# EAGLE design bare-metal-audio_2026-09-07 (EAGLE 9.7.0)
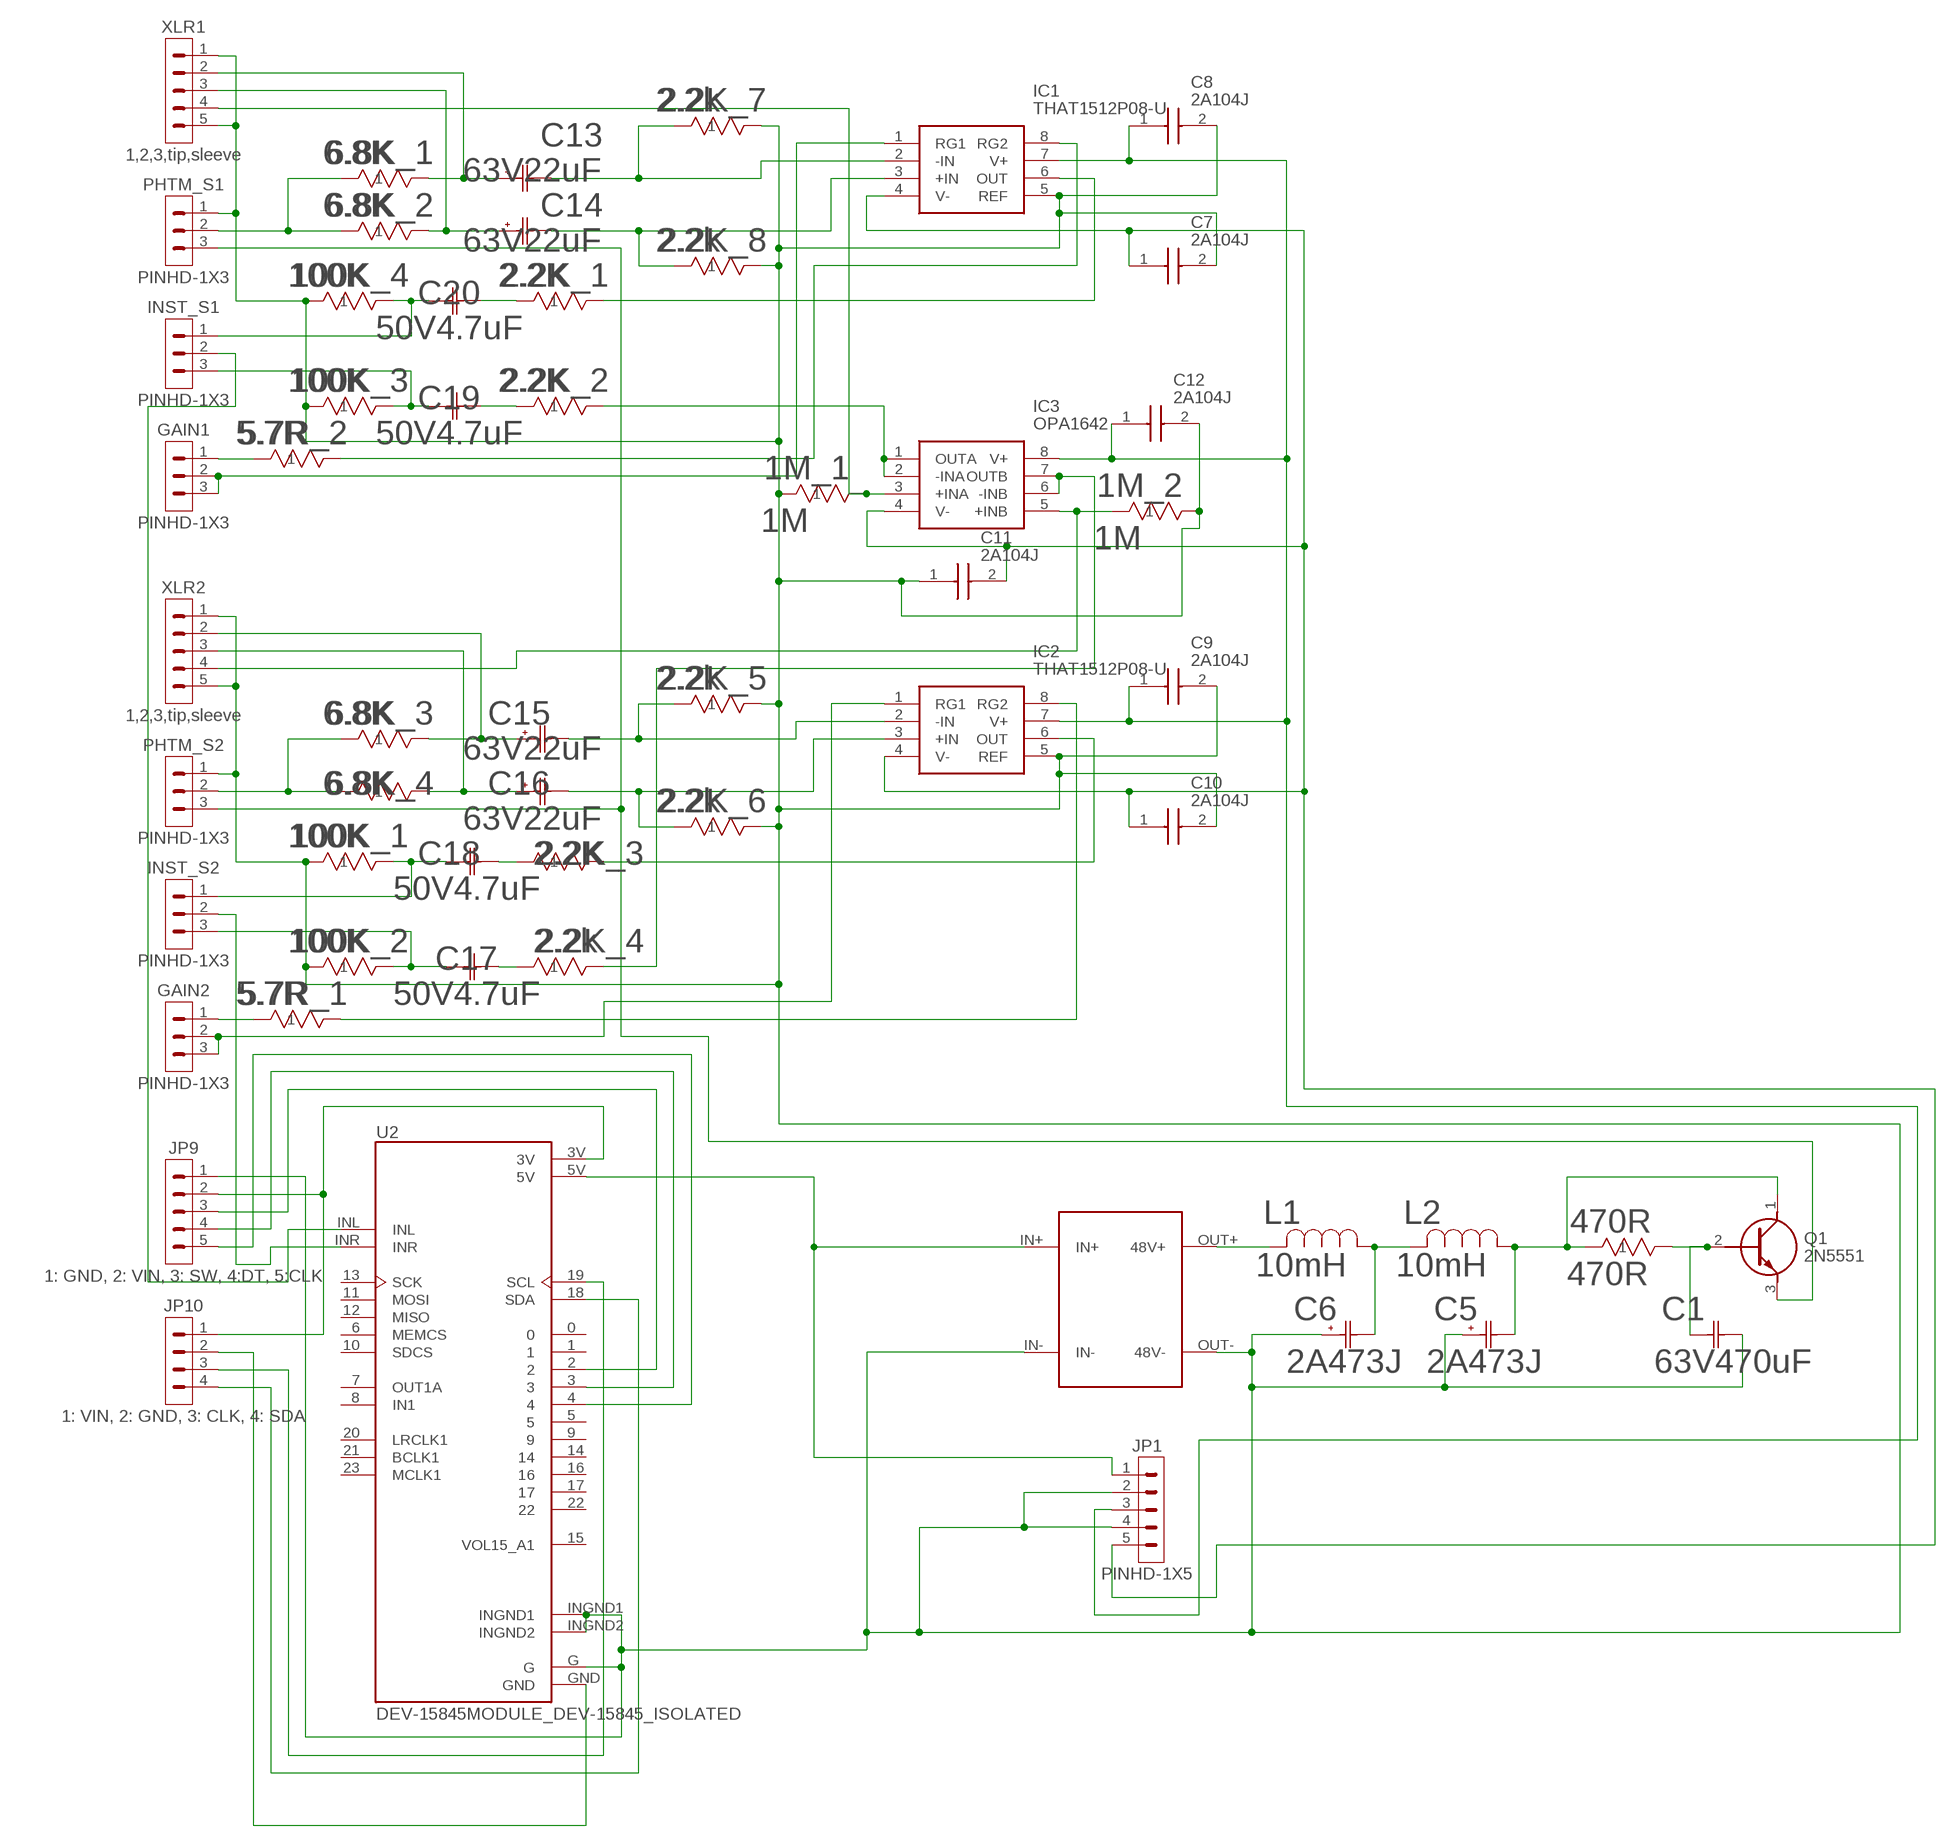
[diagram p0: schematic, sheet 1]

## Parts
1M_1  1M  YR1B100RCCRES_TYCO_YR1_TYC  [RES_TYCO_YR1_TYC]
1M_2  1M  YR1B100RCCRES_TYCO_YR1_TYC  [RES_TYCO_YR1_TYC]
2.2K_1  2.2K  YR1B100RCCRES_TYCO_YR1_TYC  [RES_TYCO_YR1_TYC]
2.2K_2  2.2K  YR1B100RCCRES_TYCO_YR1_TYC  [RES_TYCO_YR1_TYC]
2.2K_3  2.2K  YR1B100RCCRES_TYCO_YR1_TYC  [RES_TYCO_YR1_TYC]
2.2K_4  2.2k  YR1B100RCCRES_TYCO_YR1_TYC  [RES_TYCO_YR1_TYC]
2.2K_5  2.2k  YR1B100RCCRES_TYCO_YR1_TYC  [RES_TYCO_YR1_TYC]
2.2K_6  2.2k  YR1B100RCCRES_TYCO_YR1_TYC  [RES_TYCO_YR1_TYC]
2.2K_7  2.2k  YR1B100RCCRES_TYCO_YR1_TYC  [RES_TYCO_YR1_TYC]
2.2K_8  2.2k  YR1B100RCCRES_TYCO_YR1_TYC  [RES_TYCO_YR1_TYC]
5.7R_1  5.7R  YR1B100RCCRES_TYCO_YR1_TYC  [RES_TYCO_YR1_TYC]
5.7R_2  5.7R  YR1B100RCCRES_TYCO_YR1_TYC  [RES_TYCO_YR1_TYC]
6.8K_1  6.8K  YR1B100RCCRES_TYCO_YR1_TYC  [RES_TYCO_YR1_TYC]
6.8K_2  6.8K  YR1B100RCCRES_TYCO_YR1_TYC  [RES_TYCO_YR1_TYC]
6.8K_3  6.8K  YR1B100RCCRES_TYCO_YR1_TYC  [RES_TYCO_YR1_TYC]
6.8K_4  6.8K  YR1B100RCCRES_TYCO_YR1_TYC  [RES_TYCO_YR1_TYC]
100K_1  100K  YR1B100RCCRES_TYCO_YR1_TYC  [RES_TYCO_YR1_TYC]
100K_2  100K  YR1B100RCCRES_TYCO_YR1_TYC  [RES_TYCO_YR1_TYC]
100K_3  100K  YR1B100RCCRES_TYCO_YR1_TYC  [RES_TYCO_YR1_TYC]
100K_4  100K  YR1B100RCCRES_TYCO_YR1_TYC  [RES_TYCO_YR1_TYC]
470R  470R  YR1B100RCCRES_TYCO_YR1_TYC  [RES_TYCO_YR1_TYC]
C1  63V470uF  EEUFR1J471CAP_EEUFC_125X25_PAN  [CAP_EEUFC_125X25_PAN]
C5  2A473J  QYX2A473JTPCAP_QYX_4P5X8P5X14_NCH  [CAP_QYX_4P5X8P5X14_NCH]
C6  2A473J  QYX2A473JTPCAP_QYX_4P5X8P5X14_NCH  [CAP_QYX_4P5X8P5X14_NCH]
C7  2A104J  QYX2A104JTP  [QYX2A104JTP]
C8  2A104J  QYX2A104JTP  [QYX2A104JTP]
C9  2A104J  QYX2A104JTP  [QYX2A104JTP]
C10  2A104J  QYX2A104JTP  [QYX2A104JTP]
C11  2A104J  QYX2A104JTP  [QYX2A104JTP]
C12  2A104J  QYX2A104JTP  [QYX2A104JTP]
C13  63V22uF  UPW1J220MED1TDCAP_UEP_6P3X11_NCH  [CAP_UEP_6P3X11_NCH]
C14  63V22uF  UPW1J220MED1TDCAP_UEP_6P3X11_NCH  [CAP_UEP_6P3X11_NCH]
C15  63V22uF  UPW1J220MED1TDCAP_UEP_6P3X11_NCH  [CAP_UEP_6P3X11_NCH]
C16  63V22uF  UPW1J220MED1TDCAP_UEP_6P3X11_NCH  [CAP_UEP_6P3X11_NCH]
C17  50V4.7uF  EEAGA1H4R7CAP_4_X_7_PAN  [CAP_4_X_7_PAN]
C18  50V4.7uF  EEAGA1H4R7CAP_4_X_7_PAN  [CAP_4_X_7_PAN]
C19  50V4.7uF  EEAGA1H4R7CAP_4_X_7_PAN  [CAP_4_X_7_PAN]
C20  50V4.7uF  EEAGA1H4R7CAP_4_X_7_PAN  [CAP_4_X_7_PAN]
GAIN1  PINHD-1X3  [1X03]
GAIN2  PINHD-1X3  [1X03]
IC1  THAT1512P08-U  [DIP876W46P254L952H432Q8N]
IC2  THAT1512P08-U  [DIP876W46P254L952H432Q8N]
IC3  OPA1642  [DIP876W46P254L952H432Q8N]
INST_S1  PINHD-1X3  [1X03]
INST_S2  PINHD-1X3  [1X03]
JP1  PINHD-1X5  [1X05]
JP9  1: GND, 2: VIN, 3: SW, 4:DT, 5:CLK  PINHD-1X5  [1X05]
JP10  1: VIN, 2: GND, 3: CLK, 4: SDA  PINHD-1X4  [1X04]
L1  10mH  B82144A2105J000IND_B82144A_12X5P2_TDK  [IND_B82144A_12X5P2_TDK]
L2  10mH  B82144A2105J000IND_B82144A_12X5P2_TDK  [IND_B82144A_12X5P2_TDK]
PHTM_S1  PINHD-1X3  [1X03]
PHTM_S2  PINHD-1X3  [1X03]
Q1  2N5551  [2N5551]
U2  DEV-15845MODULE_DEV-15845_ISOLATED  [MODULE_DEV-15845_ISOLATED]
U$1  XL6009_BOOST  [XL6009_FOOT]
XLR1  1,2,3,tip,sleeve  PINHD-1X5  [1X05]
XLR2  1,2,3,tip,sleeve  PINHD-1X5  [1X05]

## Nets
5V: JP1.1 U2.5V U$1.IN+
+12V: C8.1 C9.1 C12.1 IC1.7(V+) IC2.7(V+) IC3.8(V+) JP1.3
-12V: C7.1 C10.1 C11.2 IC1.4(V-) IC2.4(V-) IC3.4(V-) JP1.5
GND: 1M_1.1 1M_2.2 2.2K_5.2 2.2K_6.2 2.2K_7.2 2.2K_8.2 100K_1.1 100K_2.1 100K_3.1 100K_4.1 C1.2 C5.1 C6.1 C7.2 C8.2 C9.2 C10.2 C11.1 C12.2 IC1.5(REF) IC2.5(REF) JP1.2 JP1.4 JP9.1 PHTM_S1.1 PHTM_S2.1 U2.G U2.INGND1 U2.INGND2 U$1.IN- U$1.OUT-(48V-) XLR1.1 XLR1.5 XLR2.1 XLR2.5
N$2: 6.8K_1.2 C13.1 XLR1.2
N$5: JP10.4 U2.18(SDA)
N$6: JP9.3 U2.2
N$7: JP9.4 U2.3
N$8: JP9.5 U2.4
N$9: L1.2 U$1.OUT+(48V+)
N$10: C6.2 L1.1 L2.2
N$11: 470R.1 C5.2 L2.1 Q1.1(C)
N$12: 470R.2 C1.1 Q1.2(B)
N$13: PHTM_S1.3 PHTM_S2.3 Q1.3(E)
N$14: 6.8K_1.1 6.8K_2.1 PHTM_S1.2
N$15: 6.8K_3.1 6.8K_4.1 PHTM_S2.2
N$16: 6.8K_3.2 C15.1 XLR2.2
N$17: 6.8K_4.2 C16.1 XLR2.3
N$18: 2.2K_6.1 C16.2 IC2.3(+IN)
N$19: 2.2K_5.1 C15.2 IC2.2(-IN)
N$20: GAIN1.2 GAIN1.3 IC1.1(RG1)
N$21: 6.8K_2.2 C14.1 XLR1.3
N$22: 2.2K_7.1 C13.2 IC1.2(-IN)
N$23: 2.2K_8.1 C14.2 IC1.3(+IN)
N$24: 100K_1.2 C18.1 INST_S2.1
N$25: 5.7R_2.1 GAIN1.1
N$26: 5.7R_1.1 GAIN2.1
N$27: GAIN2.2 GAIN2.3 IC2.1(RG1)
N$28: 5.7R_1.2 IC2.8(RG2)
N$29: 5.7R_2.2 IC1.8(RG2)
N$32: 2.2K_1.2 IC1.6(OUT)
N$33: 2.2K_1.1 C20.2
N$34: 100K_4.2 C20.1 INST_S1.1
N$35: 100K_3.2 C19.1 INST_S1.3
N$36: 2.2K_2.1 C19.2
N$37: 2.2K_4.2 IC3.6(-INB) IC3.7(OUTB)
N$38: 100K_2.2 C17.1 INST_S2.3
N$39: 2.2K_4.1 C17.2
N$40: 2.2K_3.1 C18.2
N$41: 2.2K_3.2 IC2.6(OUT)
N$43: 2.2K_2.2 IC3.1(OUTA) IC3.2(-INA)
N$44: 1M_1.2 IC3.3(+INA) XLR1.4
N$45: 1M_2.1 IC3.5(+INB) XLR2.4
N$46: INST_S2.2 U2.INR
N$47: INST_S1.2 U2.INL
N$48: JP10.2 U2.GND
N$49: JP10.3 U2.19(SCL)
VOL_3.3V: JP9.2 JP10.1 U2.3V
Unconnected: U2.0 U2.1 U2.5 U2.6(MEMCS) U2.7(OUT1A) U2.8(IN1) U2.9 U2.10(SDCS) U2.11(MOSI) U2.12(MISO) U2.13(SCK) U2.14 U2.15(VOL15_A1) U2.16 U2.17 U2.20(LRCLK1) U2.21(BCLK1) U2.22 U2.23(MCLK1)

## Library data of the parts
1M_1 1M_2 2.2K_1-2.2K_8 5.7R_1 5.7R_2 6.8K_1-6.8K_4 100K_1-100K_4 470R = Library_2:YR1B100RCC
C1 = Library_2:EEUFR1J471
C5 C6 = Library_2:QYX2A473JTP
C7-C12 = Library_2:QYX2A104JTP: Film Capacitors 100V 0.1uF 10% Source: Datasheet <http://www.nichicon.co.jp/english/products/pdfs/e-qyx.pdf>
C13-C16 = Library_2:UPW1J220MED1TD
C17-C20 = Library_2:EEAGA1H4R7
GAIN1 GAIN2 INST_S1 INST_S2 PHTM_S1 PHTM_S2 = Connector:PINHD-1X3: Pin Header
IC1 IC2 = THAT_LIBRARY:THAT1512P08-U: THAT CORPORATION - THAT1512P08-U - IC, PRE-AMP, MICROPHONE, DIP8 Source: Datasheet <https://componentsearchengine.com/Datasheets/2/THAT1512P08-U.pdf>
IC3 = THAT_LIBRARY_2:OPA1642: THAT CORPORATION - THAT1512P08-U - IC, PRE-AMP, MICROPHONE, DIP8 Source: Datasheet <https://componentsearchengine.com/Datasheets/2/THAT1512P08-U.pdf>
JP1 JP9 XLR1 XLR2 = Connector:PINHD-1X5: Pin Header
JP10 = Connector:PINHD-1X4: Pin Header
L1 L2 = Library_2:B82144A2105J000
Q1 = Library_2:2N5551: NPN high-voltage transistors 300 mA,160 V,50 nA,30 pF, 300 MHz 65 +150 C Source: Datasheet <https://www.nxp.com/docs/en/data-sheet/2N5550_5551.pdf>
U2 = DEV-15845_updated:DEV-15845: Check availability <https://pricing.snapeda.com/parts/DEV-15845/SparkFun%20Electronics/view-part?ref=eda>
U$1 = Library:XL6009_BOOST

## Board
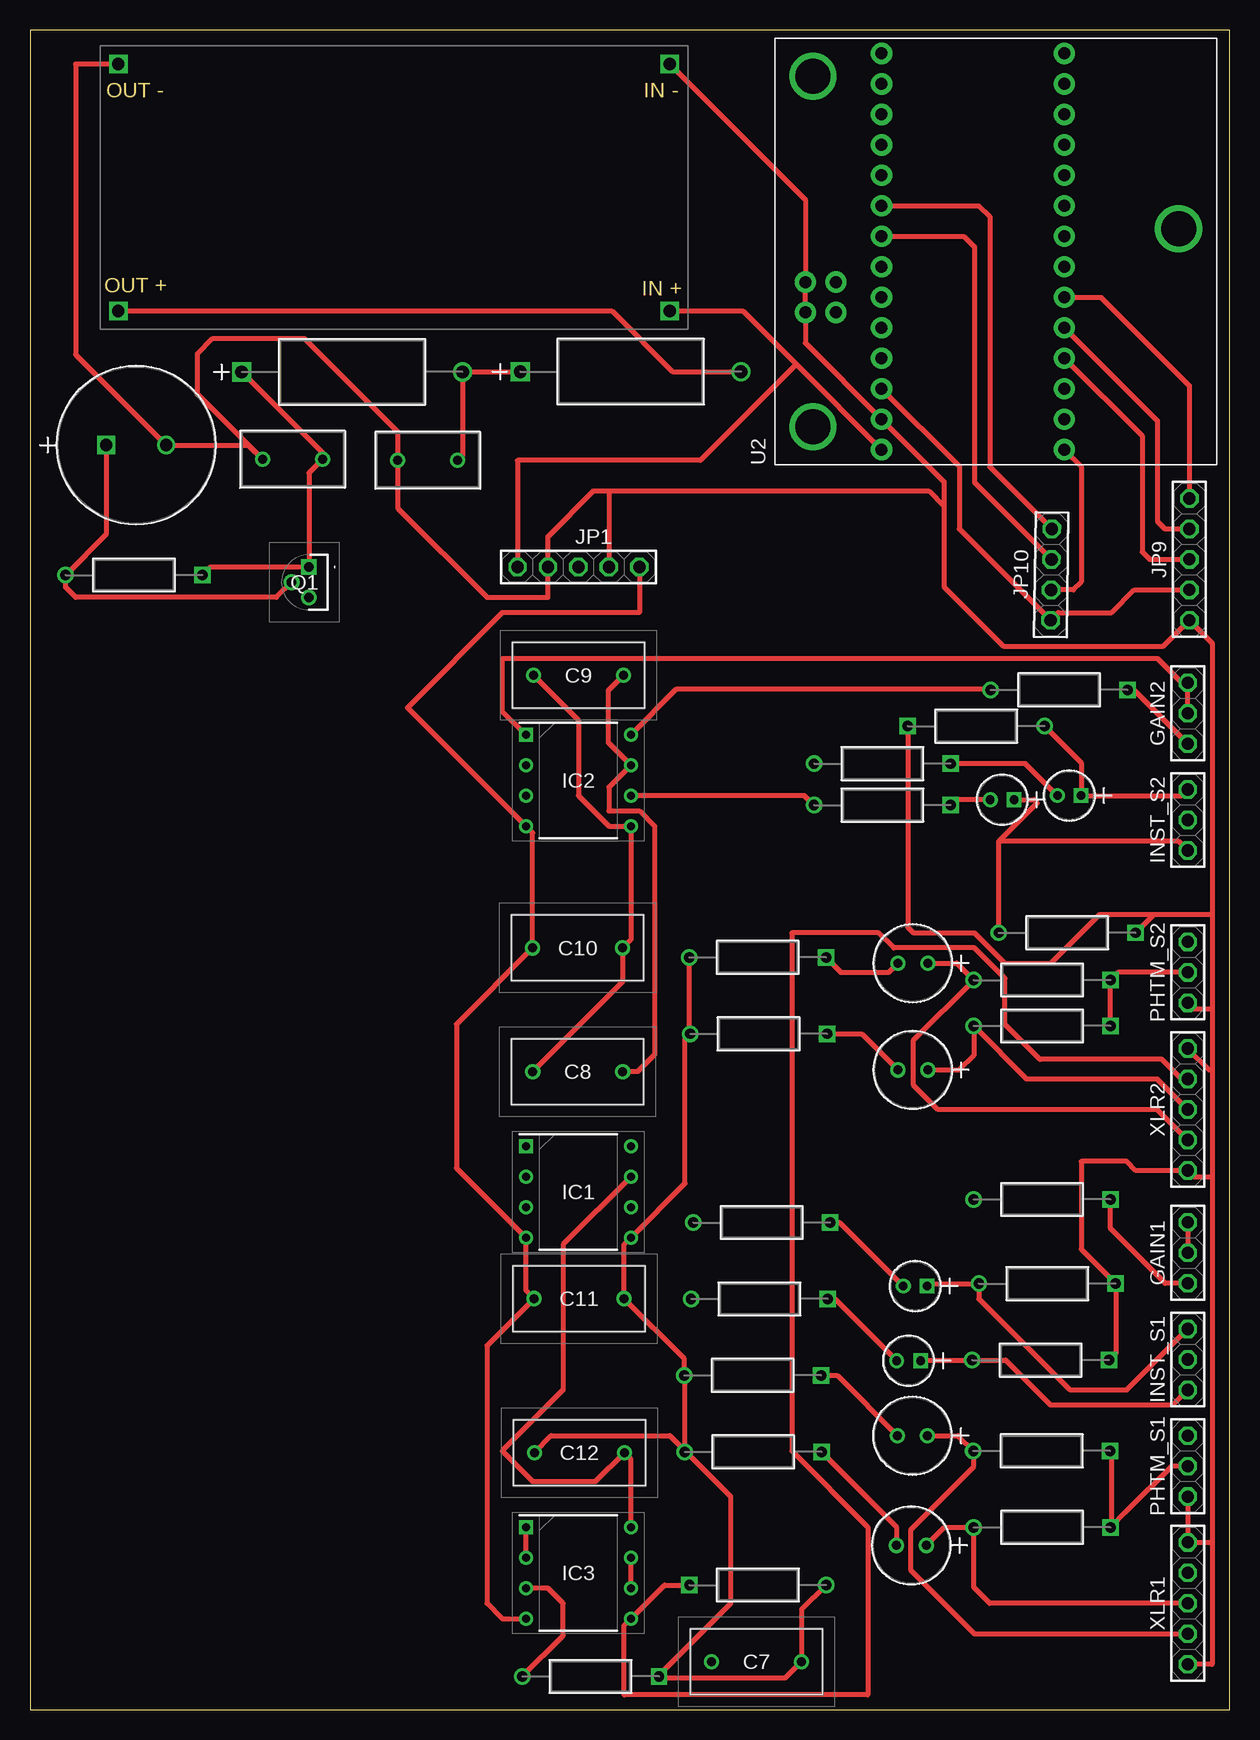
[diagram p1: board, top side]
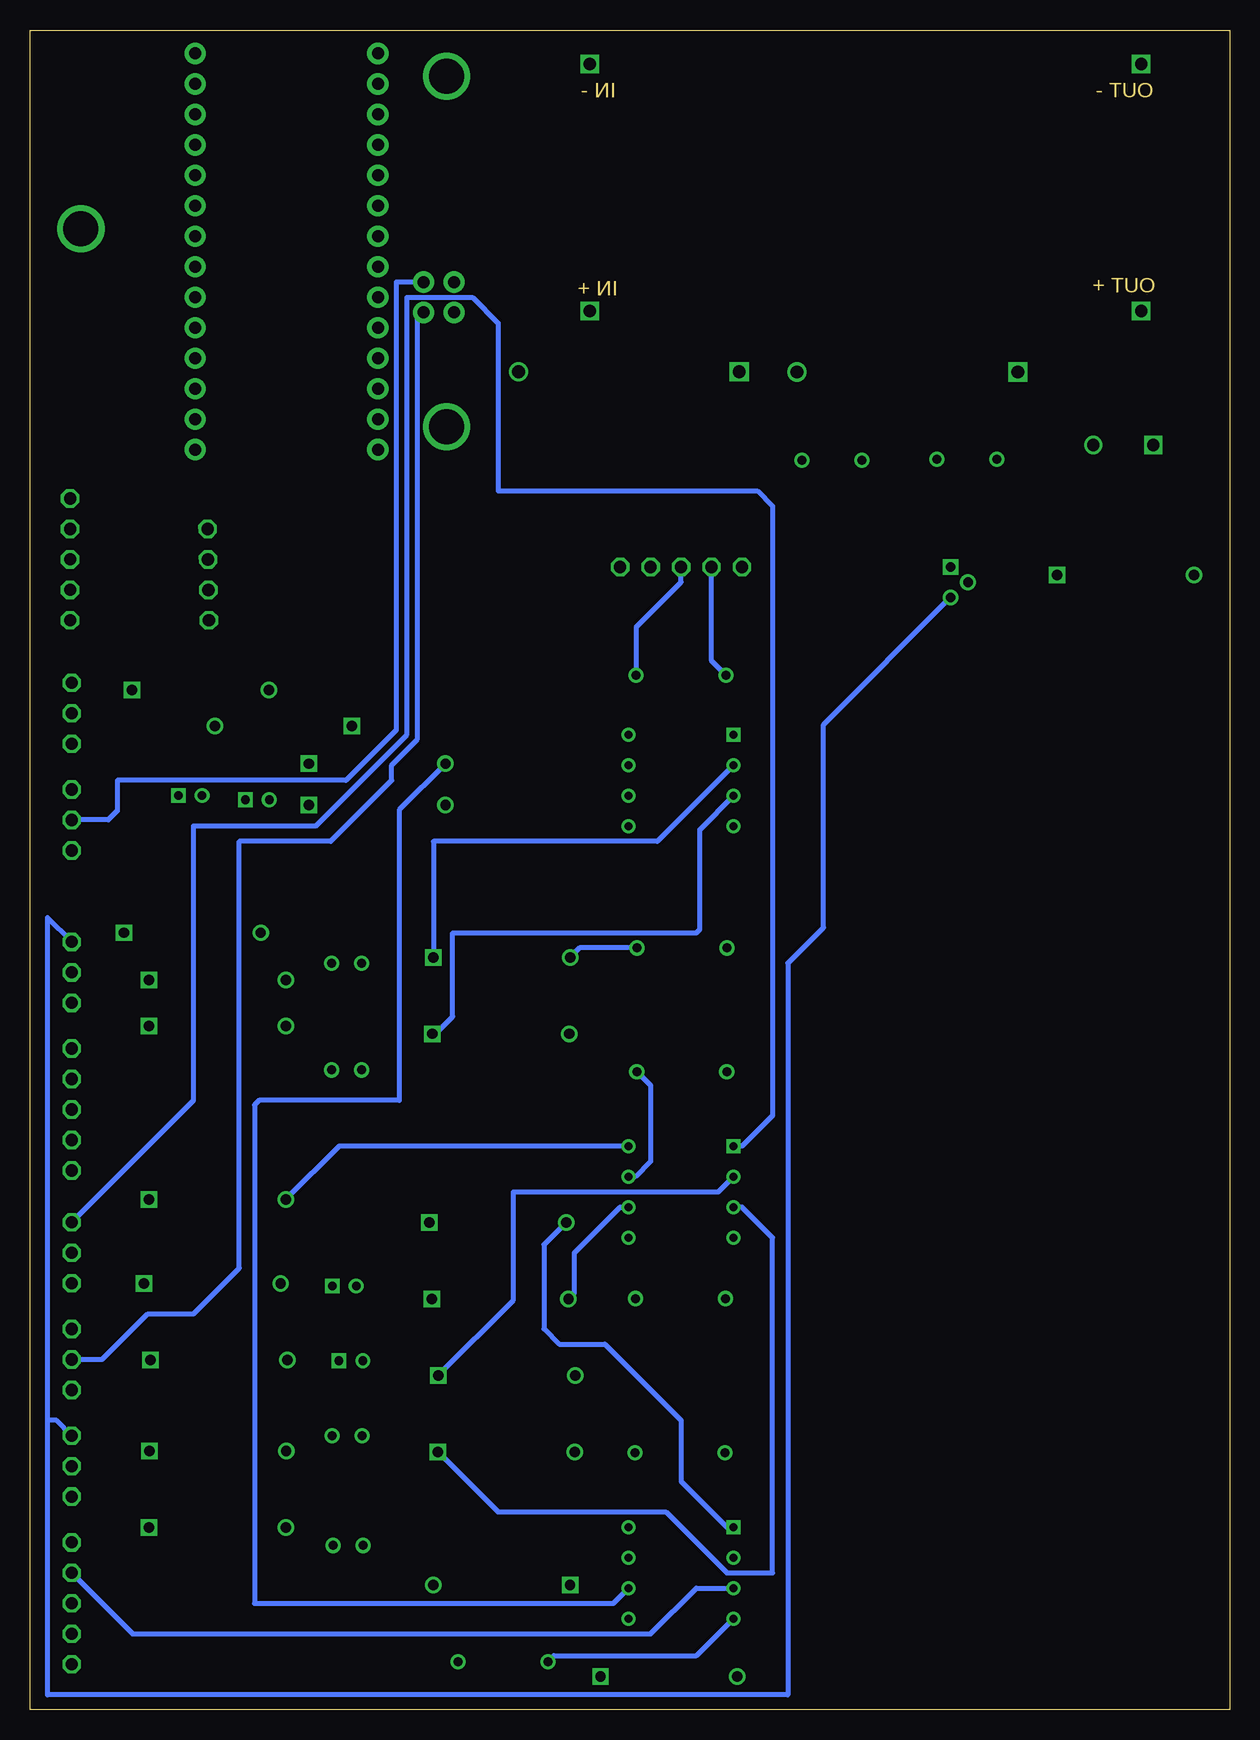
[diagram p2: board, bottom side, seen from below]

Size 100 x 140 mm. Coordinates in mm from the lower left corner, seen from the top.
Outline: 0,0 100,0 100,140 0,140 0,0
Copper layers (1*16): Top / Bottom
Stack-up Default Layer Stack: Top SilkScreen Epoxy Ink / Top SolderMask SR:Green 0.0254mm Dk 4.3 / Top Surface Finish Lead-Free 0.02mm / Top CuFoil:007 0.035mm / Dielectric-1 User Defined 1.5mm / Bottom CuFoil:007 0.035mm / Bottom Surface Finish Lead-Free 0.02mm / Bottom SolderMask SR:Green 0.0254mm Dk 4.3 / Bottom SilkScreen Epoxy Ink
Design rules: minimum drill size 35mil, minimum copper width 6mil, keepout clearance 0mil, drill distance 20mil, via restrict clearance 0mil, solder-mask clearance 0mil, dimension clearance 40mil, restrict clearance 0mil, copper clearance wire_polygon to wire_polygon 16mil, copper clearance wire_polygon to pad_smd 20mil, copper clearance wire_polygon to via 20mil, copper clearance pad_smd to pad_smd 20mil, copper clearance pad_smd to via 20mil, copper clearance via to via 20mil, copper clearance smd to pad (same net) 6mil, copper clearance smd to via (same net) 6mil, copper clearance smd to smd (same net) 6mil

### Footprints (pad centres in the part's own frame; a part is rotated, then mirrored left to right if it is on the bottom)
RES_TYCO_YR1_TYC = drill 0.864 pad 1.372 square: 1 0,0 | drill 0.864 pad 1.372: 2 11.405,0
CAP_EEUFC_125X25_PAN = drill 1.016 pad 1.524 square: 1 0,0 | drill 1.016 pad 1.524: 2 5.004,0
CAP_QYX_4P5X8P5X14_NCH = drill 0.762 pad 1.27: 1 0,0; 2 5,0
QYX2A104JTP = drill 0.75 pad 1.2: 1 0,0; 2 7.5,0
CAP_UEP_6P3X11_NCH = drill 0.762 pad 1.27: 1 0,0; 2 2.5,0
CAP_4_X_7_PAN = drill 0.711 pad 1.219 square: 1 0,0 | drill 0.711 pad 1.219: 2 1.981,0
1X03 = drill 1.016 octagon: 1 -2.54,0; 2 0,0; 3 2.54,0
DIP876W46P254L952H432Q8N = drill 0.66 pad 1.06 square: 1 -4.382,3.81 | drill 0.66 pad 1.06: 2 -4.382,1.27; 3 -4.382,-1.27; 4 -4.382,-3.81; 5 4.382,-3.81; 6 4.382,-1.27; 7 4.382,1.27; 8 4.382,3.81
1X05 = drill 1.016 octagon: 1 -5.08,0; 2 -2.54,0; 3 0,0; 4 2.54,0; 5 5.08,0
1X04 = drill 1.016 octagon: 1 -3.81,0; 2 -1.27,0; 3 1.27,0; 4 3.81,0
IND_B82144A_12X5P2_TDK = drill 1.067 pad 1.575 square: 1 0,0 | drill 1.067 pad 1.575: 2 18.4,0
2N5551 = drill 0.8 pad 1.3 square: 1 0,0 | drill 0.8 pad 1.3: 2 -1.45,-1.27; 3 0,-2.54
MODULE_DEV-15845_ISOLATED = drill 1 pad 1.778: 0 -13.97,-5.08; 1 -11.43,-5.08; 2 -8.89,-5.08; 3 -6.35,-5.08; 3V -11.43,10.16; 4 -3.81,-5.08; 5 -1.27,-5.08; 5V -16.51,10.16; 6 1.27,-5.08; 7 3.81,-5.08; 8 6.35,-5.08; 9 8.89,-5.08; 10 11.43,-5.08; 11 13.97,-5.08; 12 16.51,-5.08; 13 16.51,10.16; 14 13.97,10.16; 15 11.43,10.16; 16 8.89,10.16; 17 6.35,10.16; 18 3.81,10.16; 19 1.27,10.16; 20 -1.27,10.16; 21 -3.81,10.16; 22 -6.35,10.16; 23 -8.89,10.16; G -13.97,10.16; GND -16.51,-5.08; INGND1 -5.08,16.51; INGND2 -2.54,16.51; INL -5.08,13.97; INR -2.54,13.97 | drill 2.921: S1 -14.605,15.875; S2 14.605,15.875; S3 1.905,-14.605
XL6009_FOOT = drill 1.016 square: IN+ 0,20.574; IN- 0,0; OUT+ 45.974,20.574; OUT- 45.974,0

### Placement (x,y rotation side)
1M_1  52.44,2.79 180 top
1M_2  54.97,10.42 0 top
2.2K_1  66.51,34.25 180 top
2.2K_2  66.7,40.62 180 top
2.2K_3  76.76,75.41 180 top
2.2K_4  76.76,78.86 180 top
2.2K_5  66.37,62.72 180 top
2.2K_6  66.44,56.35 180 top
2.2K_7  65.96,27.88 180 top
2.2K_8  66,21.51 180 top
5.7R_1  91.49,85.01 180 top
5.7R_2  90.07,42.55 180 top
6.8K_1  90.05,21.59 180 top
6.8K_2  90.07,15.22 180 top
6.8K_3  90.07,60.83 180 top
6.8K_4  90.07,57 180 top
100K_1  92.17,64.77 180 top
100K_2  73.18,81.99 0 top
100K_3  90.51,35.53 180 top
100K_4  89.96,29.16 180 top
470R  14.38,94.58 180 top
C1  6.35,105.41 0 top
C5  19.39,104.22 0 top
C6  30.66,104.14 0 top
C7  56.82,4.03 0 top
C8  49.42,53.2 180 top
C9  49.48,86.22 180 top
C10  41.91,63.5 0 top
C11  49.53,34.29 180 top
C12  49.55,21.45 180 top
C13  74.82,22.86 180 top
C14  74.72,13.72 180 top
C15  74.85,62.23 180 top
C16  74.85,53.34 180 top
C17  87.63,76.2 180 top
C18  82.04,75.86 180 top
C19  74.79,35.32 180 top
C20  74.24,29.1 180 top
GAIN1  96.52,38.1 90 top
GAIN2  96.52,83.06 90 top
IC1  45.72,43.18 0 top
IC2  45.72,77.47 0 top
IC3  45.72,11.43 0 top
INST_S1  96.52,29.21 90 top
INST_S2  96.52,74.17 90 top
JP1  45.72,95.25 0 top
JP9  96.66,95.88 90 top
JP10  85.14,94.61 89.2 top
L1  40.87,111.53 0 top
L2  17.65,111.51 0 top
PHTM_S1  96.52,20.32 90 top
PHTM_S2  96.52,61.47 90 top
Q1  23.26,95.25 0 top
U2  81.15,121.54 90 top
U$1  53.34,137.16 180 top
XLR1  96.52,8.89 90 top
XLR2  96.52,50.04 90 top

### Tracks (layer width: path | path; a pad name or v marks a point on that pad's centre or on a via)
5V
  Top 0.406: U$1.IN+ 59.44,116.59 63.88,112.14 | 63.88,112.14 U2.5V | 63.88,112.14 55.88,104.14 40.64,104.14 JP1.1
+12V
  Top 0.406: IC3.8 50.1,20.9 C12.1 47.15,19.05 41.91,19.05 39.37,21.59 44.45,26.67 44.45,38.8 IC1.7 | C9.1 48.21,84.95 48.21,80.64 IC2.7 48.26,76.9 48.26,74.93 50.8,74.93 52.07,73.66 52.07,54.61 50.66,53.2 C8.1
  Bottom 0.406: JP1.3 45.72,93.98 49.48,90.22 C9.1 | C8.1 48.26,52.05 48.26,45.72 49.53,44.45 IC1.7
-12V
  Top 0.406: JP1.5 50.8,91.44 39.37,91.44 31.46,83.53 IC2.4 41.91,73.09 C10.1 35.56,57.15 35.56,45.15 IC1.4 41.34,34.98 C11.2 38.1,30.36 38.1,8.89 39.37,7.62 IC3.4
  Bottom 0.406: IC3.4 44.42,4.54 56.31,4.54 C7.1
GND
  Top 0.406: U$1.OUT- 3.81,137.16 3.81,112.95 C1.2 18.2,105.41 C5.1 13.97,109.64 13.97,113.03 15.24,114.3 22.86,114.3 30.66,106.5 C6.1 30.66,100.16 38.1,92.71 43.18,92.71 JP1.2 43.18,97.79 46.99,101.6 48.26,101.6 | U$1.IN- 64.64,125.86 U2.INGND2 U2.INGND1 64.64,113.92 U2.G 76.2,102.36 76.2,100.33 | C9.2 45.72,82.48 45.72,76.2 48.26,73.66 IC2.5 50.1,64.19 C10.2 49.41,60.7 C8.2 | 76.2,100.33 76.2,93.6 81.15,88.65 94.5,88.65 JP9.1 98.55,88.91 98.55,66.31 | 98.55,66.31 98.55,58.42 | 98.55,58.42 98.55,53.34 | 98.55,53.34 98.55,44.45 | 98.55,44.45 98.55,13.97 | 98.55,13.97 98.55,3.81 XLR1.1 | 98.55,13.97 XLR1.5 PHTM_S1.1 | 100K_4.1 90.51,29.71 100K_3.1 87.63,38.4 87.63,45.72 91.44,45.72 92.2,44.96 XLR2.1 97.03,44.45 98.55,44.45 | XLR2.5 98.3,53.34 98.55,53.34 | 100K_1.1 93.71,66.31 | 93.71,66.31 98.55,66.31 | 1M_2.2 64.32,8.36 C7.2 62.96,2.67 52.57,2.67 1M_1.1 52.44,2.91 58.42,8.89 58.42,17.78 54.69,21.51 | 54.69,21.51 2.2K_8.2 54.59,27.84 2.2K_7.2 54.56,29.26 C11.1 49.53,38.8 IC1.5 54.61,43.88 54.61,55.92 2.2K_6.2 54.96,56.43 2.2K_5.2 | C12.2 43.46,22.86 53.34,22.86 54.69,21.51 | 100K_2.1 73.18,65.25 73.66,64.77 78.74,64.77 81.28,62.23 85.09,62.23 89.17,66.31 93.71,66.31 | 48.26,101.6 74.93,101.6 76.2,100.33 | PHTM_S2.1 97.03,58.42 98.55,58.42 | 48.26,101.6 JP1.4
  Bottom 0.406: C10.2 54.18,63.5 2.2K_5.2 | C9.2 43.18,87.43 JP1.2
N$2
  Top 0.406: XLR1.2 78.74,6.35 73.41,11.68 73.41,14.99 78.64,20.22 6.8K_1.2 77.37,22.86 C13.1
N$5
  Top 0.406: U2.18 79.12,125.35 80.01,124.46 80.01,103.6 JP10.4
N$6
  Top 0.406: U2.2 92.71,106.17 92.71,96.52 93.35,95.88 JP9.3
N$7
  Top 0.406: U2.3 93.98,107.44 93.98,99.06 94.62,98.42 JP9.4
N$8
  Top 0.406: U2.4 89.28,117.73 96.66,110.36 JP9.5
N$9
  Top 0.406: U$1.OUT+ 48.51,116.59 53.57,111.53 L1.2
N$10
  Top 0.406: L1.1 36.08,111.53 L2.2 36.05,104.54 C6.2
N$11
  Top 0.406: L2.1 24.39,104.77 C5.2 23.26,103.09 Q1.1 15.04,95.25 470R.1
N$12
  Top 0.406: C1.1 6.35,97.96 470R.2 2.97,93.55 3.81,92.71 20.54,92.71 Q1.2
N$13
  Bottom 0.406: 98.55,24.13 98.55,66.04 PHTM_S2.3 | 98.55,24.13 98.55,1.27 36.83,1.27 36.83,62.23 33.85,65.21 33.85,82.11 Q1.3 | PHTM_S1.3 97.79,24.13 98.55,24.13
N$14
  Top 0.406: 6.8K_2.1 90.13,15.28 | 90.13,15.28 91.37,16.51 95.18,20.32 PHTM_S1.2 | 6.8K_1.1 90.13,21.5 90.13,15.28
N$15
  Top 0.406: 6.8K_4.1 6.8K_3.1 90.71,61.47 PHTM_S2.2
N$16
  Top 0.406: C15.1 77.27,62.23 6.8K_3.2 73.66,55.83 73.66,52.07 75.69,50.04 93.98,50.04 XLR2.2
N$17
  Top 0.406: C16.1 77.47,53.34 78.67,54.54 6.8K_4.2 83.09,52.58 93.98,52.58 XLR2.3
N$18
  Top 0.406: 2.2K_6.1 69.34,56.35 C16.2
  Bottom 0.406: IC2.3 44.16,73.37 44.16,65.06 44.45,64.77 64.77,64.77 64.77,57.78 66.2,56.35 2.2K_6.1
N$19
  Top 0.406: 2.2K_5.1 67.64,61.45 71.57,61.45 C15.2
  Bottom 0.406: IC2.2 47.69,72.39 66.37,72.39 2.2K_5.1
N$20
  Top 0.406: GAIN1.3 GAIN1.2
  Bottom 0.406: GAIN1.3 86.36,50.8 86.36,73.66 76.2,73.66 68.58,81.28 68.58,117.73 63.12,117.73 60.96,115.57 60.96,101.6 39.37,101.6 38.1,100.33 38.1,49.53 40.64,46.99 IC1.1
N$21
  Top 0.406: XLR1.3 80.01,8.89 78.67,10.23 6.8K_2.2 76.22,15.22 C14.1
N$22
  Top 0.406: 2.2K_7.1 67.3,27.88 C13.2
  Bottom 0.406: 2.2K_7.1 59.69,34.15 59.69,43.18 42.61,43.18 IC1.2
N$23
  Top 0.406: 2.2K_8.1 72.22,15.29 C14.2
  Bottom 0.406: 2.2K_8.1 61,16.51 46.99,16.51 41.91,11.43 38.1,11.43 38.1,39.37 40.64,41.91 IC1.3
N$24
  Top 0.406: C18.1 83.69,75.86 83.96,75.58 80.77,72.39 | 100K_1.2 80.77,72.39 | INST_S2.1 95.76,72.39 80.77,72.39
N$25
  Top 0.406: GAIN1.1 94.64,35.56 90.07,40.13 5.7R_2.1
N$26
  Top 0.406: GAIN2.1 92.03,85.01 5.7R_1.1
N$27
  Top 0.406: GAIN2.2 96.52,85.09 | 96.52,85.09 GAIN2.3 96.01,85.6 | IC2.1 39.37,83.25 39.37,87.63 93.98,87.63 96.01,85.6 | 96.01,85.6 96.52,85.09
N$28
  Top 0.406: IC2.8 53.91,85.09 80,85.09 5.7R_1.2
N$29
  Bottom 0.406: IC1.8 74.22,46.99 5.7R_2.2
N$32
  Bottom 0.406: IC1.6 50.8,41.91 54.61,38.1 54.61,34.75 2.2K_1.2
N$33
  Top 0.406: 2.2K_1.1 67.11,34.25 C20.2
N$34
  Top 0.406: C20.1 74.29,29.16 100K_4.2 81.33,29.16 85.09,25.4 95.25,25.4 INST_S1.1
N$35
  Top 0.406: C19.1 74.99,35.53 100K_3.2 79.1,34.26 86.69,26.67 91.44,26.67 INST_S1.3
N$36
  Top 0.406: 2.2K_2.1 67.51,40.62 C19.2
N$37
  Top 0.406: IC3.6 IC3.7
  Bottom 0.406: 2.2K_4.2 69.22,75 69.22,50.8 80.9,50.8 81.28,50.42 81.28,8.89 51.37,8.89 IC3.6
N$38
  Top 0.406: 100K_2.2 87.63,78.94 C17.1 96.01,76.2 INST_S2.3
N$39
  Top 0.406: C17.2 82.99,78.86 2.2K_4.1
N$40
  Top 0.406: C18.2 77.21,75.86 2.2K_3.1
N$41
  Top 0.406: 2.2K_3.2 64.57,76.2 IC2.6
N$43
  Top 0.406: IC3.2 IC3.1
  Bottom 0.406: 2.2K_2.2 57.15,38.77 57.15,31.75 55.88,30.48 52.07,30.48 45.72,24.13 45.72,19.05 41.91,15.24 IC3.1
N$44
  Top 0.406: 1M_1.2 44.45,6.21 44.45,8.89 43.18,10.16 IC3.3
  Bottom 0.406: XLR1.4 91.44,6.35 48.26,6.35 44.45,10.16 IC3.3
N$45
  Top 0.406: 1M_2.1 52.9,10.42 IC3.5 49.53,7.05 49.53,1.27 69.85,1.27 69.85,15.24 63.5,21.59 63.5,64.77 70.74,64.77 72.01,63.5 78.74,63.5 81.28,60.96 81.28,57.15 84.2,54.23 94.36,54.23 96.01,52.58 XLR2.4
N$46
  Bottom 0.406: U2.INR 69.47,119 69.47,81.66 73.66,77.47 92.71,77.47 92.71,74.93 93.47,74.17 INST_S2.2
N$47
  Bottom 0.406: INST_S1.2 93.98,29.21 90.17,33.02 86.36,33.02 82.55,36.83 82.55,72.39 74.93,72.39 69.85,77.47 69.85,78.74 67.69,80.9 67.69,115.95 U2.INL
N$48
  Top 0.406: U2.GND 87.63,103.63 87.63,93.98 86.99,93.34 JP10.2
N$49
  Top 0.406: U2.19 77.85,122.81 78.74,121.92 78.74,102.3 JP10.3
VOL_3.3V
  Top 0.406: U2.3V 77.47,103.63 77.47,98.42 JP10.1 85.73,91.44 90.17,91.44 92.07,93.34 JP9.2